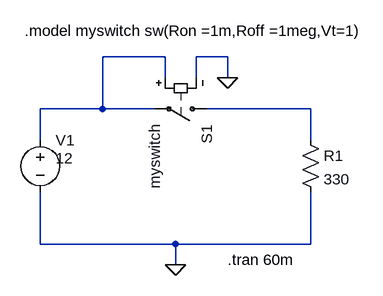
[diagram p0: schematic switch in LTspice.asc]
switch in LTspice.asc, the LTspice schematic file:
Version 4.1
SHEET 1 1000 680
WIRE 224 32 128 32
WIRE 320 32 272 32
WIRE 224 64 224 32
WIRE 272 64 272 32
WIRE 320 64 320 32
WIRE 128 112 128 32
WIRE 128 112 32 112
WIRE 208 112 128 112
WIRE 448 112 288 112
WIRE 32 160 32 112
WIRE 448 160 448 112
WIRE 32 320 32 240
WIRE 240 320 32 320
WIRE 448 320 448 240
WIRE 448 320 240 320
WIRE 240 352 240 320
FLAG 240 352 0
FLAG 320 64 0
SYMBOL sw 304 112 R90
SYMATTR InstName S1
SYMATTR Value myswitch
SYMBOL voltage 32 144 R0
WINDOW 3 24 44 Left 2
WINDOW 123 0 0 Left 0
WINDOW 39 0 0 Left 0
SYMATTR Value 12
SYMATTR InstName V1
SYMBOL res 432 144 R0
SYMATTR InstName R1
SYMATTR Value 330
TEXT 320 344 Left 2 !.tran 60m
TEXT 8 -8 Left 2 !.model myswitch sw(Ron =1m,Roff =1meg,Vt=1)

The netlist it stands for:
* switch in LTspice.asc
S1 N002 N001 N001 0 myswitch
V1 N001 0 12
R1 N002 0 330
.tran 60m
.model myswitch sw(Ron =1m,Roff =1meg,Vt=1)
.backanno
.end